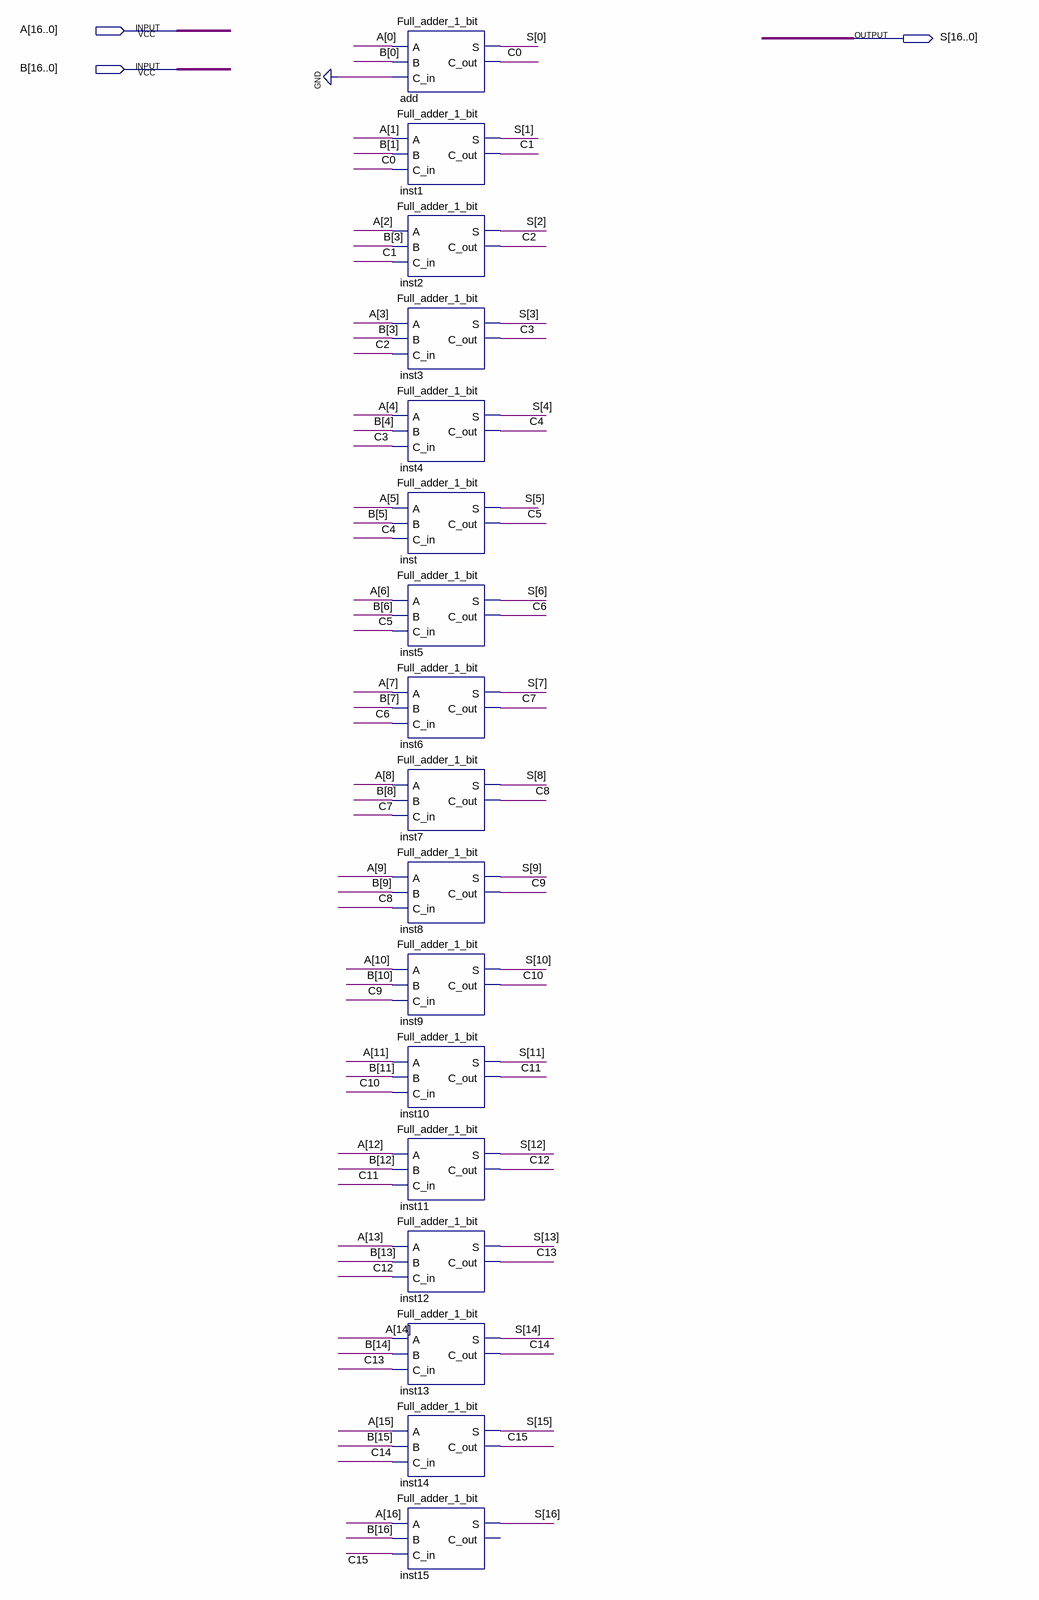
[diagram p0: schematic sheet]
// Quartus schematic FA17bit.bdf as structural Verilog: 17 symbols, 3 pins
module FA17bit (
  input  [16:0] A,
  input  [16:0] B,
  output [16:0] S
);

  wire C0, C1, C2, C3, C4, C5, C6, C7, C8, C9, C10, C11, C12, C13, C14, C15;

  Full_adder_1_bit add (.A(A[0]), .B(B[0]), .C_in(1'b0), .S(S[0]), .C_out(C0));
  Full_adder_1_bit inst1 (.A(A[1]), .B(B[1]), .C_in(C0), .S(S[1]), .C_out(C1));
  Full_adder_1_bit inst2 (.A(A[2]), .B(B[3]), .C_in(C1), .S(S[2]), .C_out(C2));
  Full_adder_1_bit inst3 (.A(A[3]), .B(B[3]), .C_in(C2), .S(S[3]), .C_out(C3));
  Full_adder_1_bit inst4 (.A(A[4]), .B(B[4]), .C_in(C3), .S(S[4]), .C_out(C4));
  Full_adder_1_bit inst (.A(A[5]), .B(B[5]), .C_in(C4), .S(S[5]), .C_out(C5));
  Full_adder_1_bit inst5 (.A(A[6]), .B(B[6]), .C_in(C5), .S(S[6]), .C_out(C6));
  Full_adder_1_bit inst6 (.A(A[7]), .B(B[7]), .C_in(C6), .S(S[7]), .C_out(C7));
  Full_adder_1_bit inst7 (.A(A[8]), .B(B[8]), .C_in(C7), .S(S[8]), .C_out(C8));
  Full_adder_1_bit inst8 (.A(A[9]), .B(B[9]), .C_in(C8), .S(S[9]), .C_out(C9));
  Full_adder_1_bit inst9 (.A(A[10]), .B(B[10]), .C_in(C9), .S(S[10]), .C_out(C10));
  Full_adder_1_bit inst10 (.A(A[11]), .B(B[11]), .C_in(C10), .S(S[11]), .C_out(C11));
  Full_adder_1_bit inst11 (.A(A[12]), .B(B[12]), .C_in(C11), .S(S[12]), .C_out(C12));
  Full_adder_1_bit inst12 (.A(A[13]), .B(B[13]), .C_in(C12), .S(S[13]), .C_out(C13));
  Full_adder_1_bit inst13 (.A(A[14]), .B(B[14]), .C_in(C13), .S(S[14]), .C_out(C14));
  Full_adder_1_bit inst14 (.A(A[15]), .B(B[15]), .C_in(C14), .S(S[15]), .C_out(C15));
  Full_adder_1_bit inst15 (.A(A[16]), .B(B[16]), .C_in(C15), .S(S[16]));  // open: C_out
endmodule
